# Altium schematic sheet Relay_Section.SchDoc: =Projectname
size A4; DocumentNumber: 7; SheetNumber: 7; SheetTotal: 8
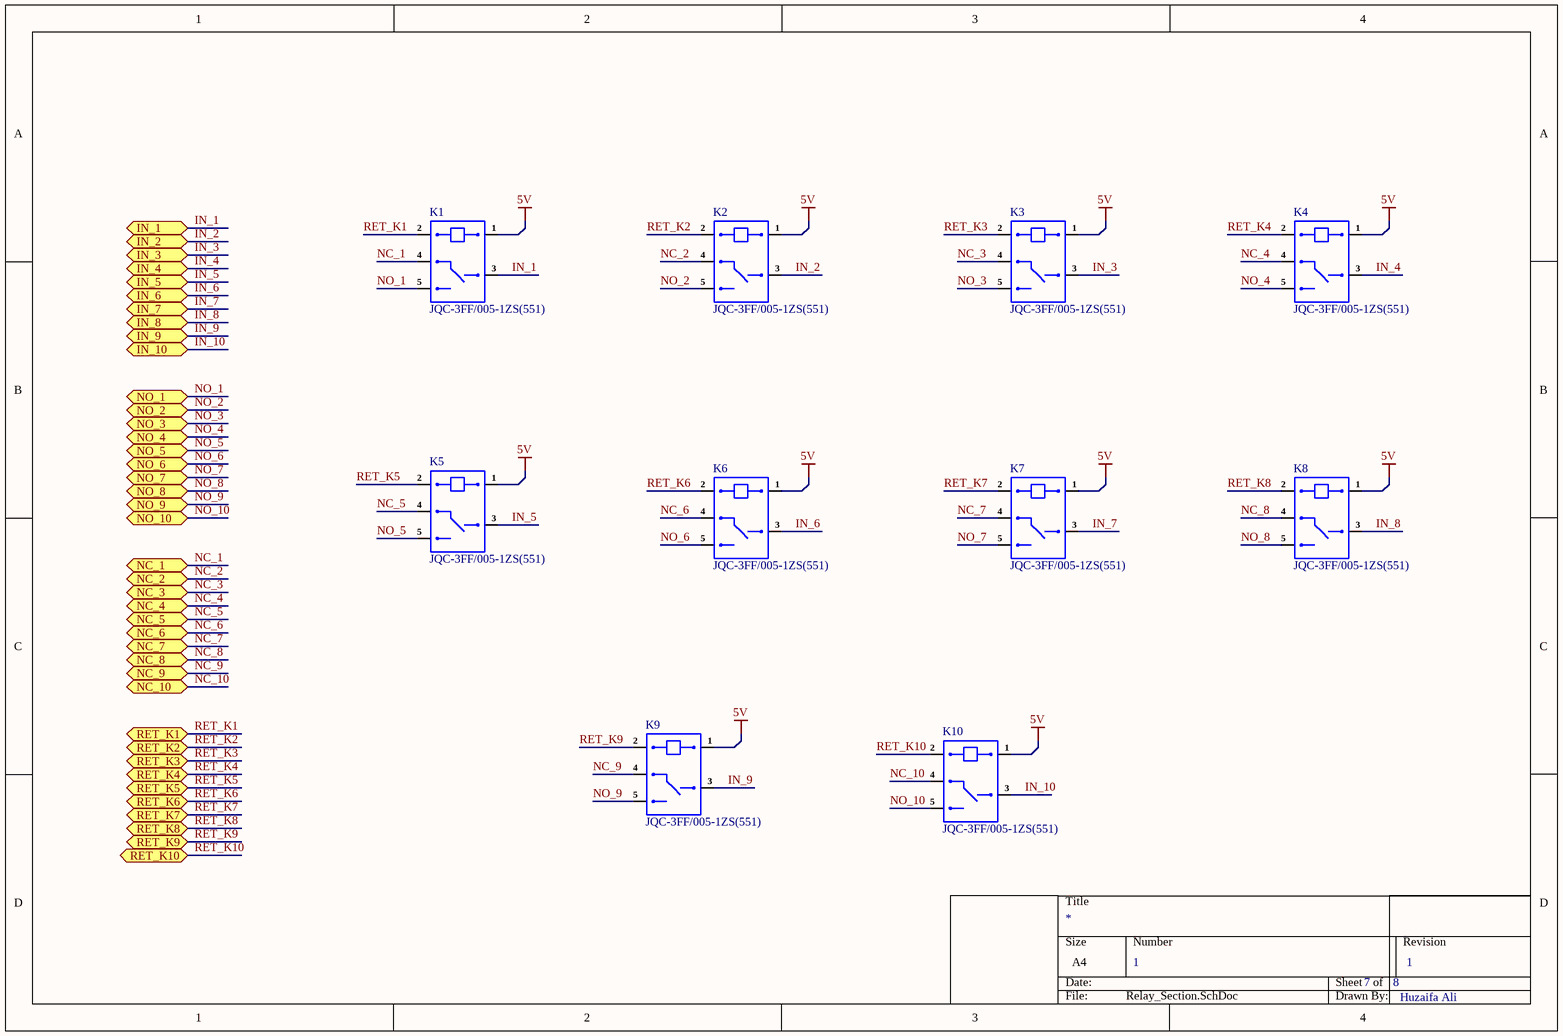
[diagram p0: Relay_Section.SchDoc]

## Parts
K1  JQC-3FF/005-1ZS(551)  [JQC-3FF/005-1ZS(551)]
K2  JQC-3FF/005-1ZS(551)  [JQC-3FF/005-1ZS(551)]
K3  JQC-3FF/005-1ZS(551)  [JQC-3FF/005-1ZS(551)]
K4  JQC-3FF/005-1ZS(551)  [JQC-3FF/005-1ZS(551)]
K5  JQC-3FF/005-1ZS(551)  [JQC-3FF/005-1ZS(551)]
K6  JQC-3FF/005-1ZS(551)  [JQC-3FF/005-1ZS(551)]
K7  JQC-3FF/005-1ZS(551)  [JQC-3FF/005-1ZS(551)]
K8  JQC-3FF/005-1ZS(551)  [JQC-3FF/005-1ZS(551)]
K9  JQC-3FF/005-1ZS(551)  [JQC-3FF/005-1ZS(551)]
K10  JQC-3FF/005-1ZS(551)  [JQC-3FF/005-1ZS(551)]

## Ports
IN_1 (bidir), IN_2 (bidir), IN_3 (bidir), IN_4 (bidir), IN_5 (bidir), IN_6 (bidir), IN_7 (bidir), IN_8 (bidir), IN_9 (bidir), IN_10 (bidir), NC_1 (bidir), NC_2 (bidir), NC_3 (bidir), NC_4 (bidir), NC_5 (bidir), NC_6 (bidir), NC_7 (bidir), NC_8 (bidir), NC_9 (bidir), NC_10 (bidir), NO_1 (bidir), NO_2 (bidir), NO_3 (bidir), NO_4 (bidir), NO_5 (bidir), NO_6 (bidir), NO_7 (bidir), NO_8 (bidir), NO_9 (bidir), NO_10 (bidir), RET_K1 (bidir), RET_K2 (bidir), RET_K3 (bidir), RET_K4 (bidir), RET_K5 (bidir), RET_K6 (bidir), RET_K7 (bidir), RET_K8 (bidir), RET_K9 (bidir), RET_K10 (bidir)

## Nets
5V: K1.1 K2.1 K3.1 K4.1 K5.1 K6.1 K7.1 K8.1 K9.1 K10.1
IN_1: K1.3 ; port IN_1
IN_2: K2.3 ; port IN_2
IN_3: K3.3 ; port IN_3
IN_4: K4.3 ; port IN_4
IN_5: K5.3 ; port IN_5
IN_6: K6.3 ; port IN_6
IN_7: K7.3 ; port IN_7
IN_8: K8.3 ; port IN_8
IN_9: K9.3 ; port IN_9
IN_10: K10.3 ; port IN_10
NC_1: K1.4 ; port NC_1
NC_2: K2.4 ; port NC_2
NC_3: K3.4 ; port NC_3
NC_4: K4.4 ; port NC_4
NC_5: K5.4 ; port NC_5
NC_6: K6.4 ; port NC_6
NC_7: K7.4 ; port NC_7
NC_8: K8.4 ; port NC_8
NC_9: K9.4 ; port NC_9
NC_10: K10.4 ; port NC_10
NO_1: K1.5 ; port NO_1
NO_2: K2.5 ; port NO_2
NO_3: K3.5 ; port NO_3
NO_4: K4.5 ; port NO_4
NO_5: K5.5 ; port NO_5
NO_6: K6.5 ; port NO_6
NO_7: K7.5 ; port NO_7
NO_8: K8.5 ; port NO_8
NO_9: K9.5 ; port NO_9
NO_10: K10.5 ; port NO_10
RET_K1: K1.2 ; port RET_K1
RET_K2: K2.2 ; port RET_K2
RET_K3: K3.2 ; port RET_K3
RET_K4: K4.2 ; port RET_K4
RET_K5: K5.2 ; port RET_K5
RET_K6: K6.2 ; port RET_K6
RET_K7: K7.2 ; port RET_K7
RET_K8: K8.2 ; port RET_K8
RET_K9: K9.2 ; port RET_K9
RET_K10: K10.2 ; port RET_K10

## Notes on the sheet
- 1
- Huzaifa Ali

## Library data of the parts
K1-K10 = JQC-3FF/005-1ZS(551): AgCdO 5V 10A SPDT (1 Form C) Electromagnetic Relay-Single Coil Plugin Power Relays ROHS; Manufacturer: HF(Xiamen Hongfa Electroacoustic); Item Type: Relay; Manufacturer Part Number: JQC-3FF/005-1ZS(551); Package: Plugin; LCSC Part Number: C9221; ComponentLink1Description: LCSC; ComponentLink1URL: https://www.lcsc.com/product-detail/Power-Relays_HF-Xiamen-Hongfa-Electroacoustic-JQC-3FF-005-1ZS-551_C9221.html